# Altium schematic sheet board.SchDoc: Display & buttons board
size A3; Revision: 1; SheetNumber: 6; SheetTotal: 29
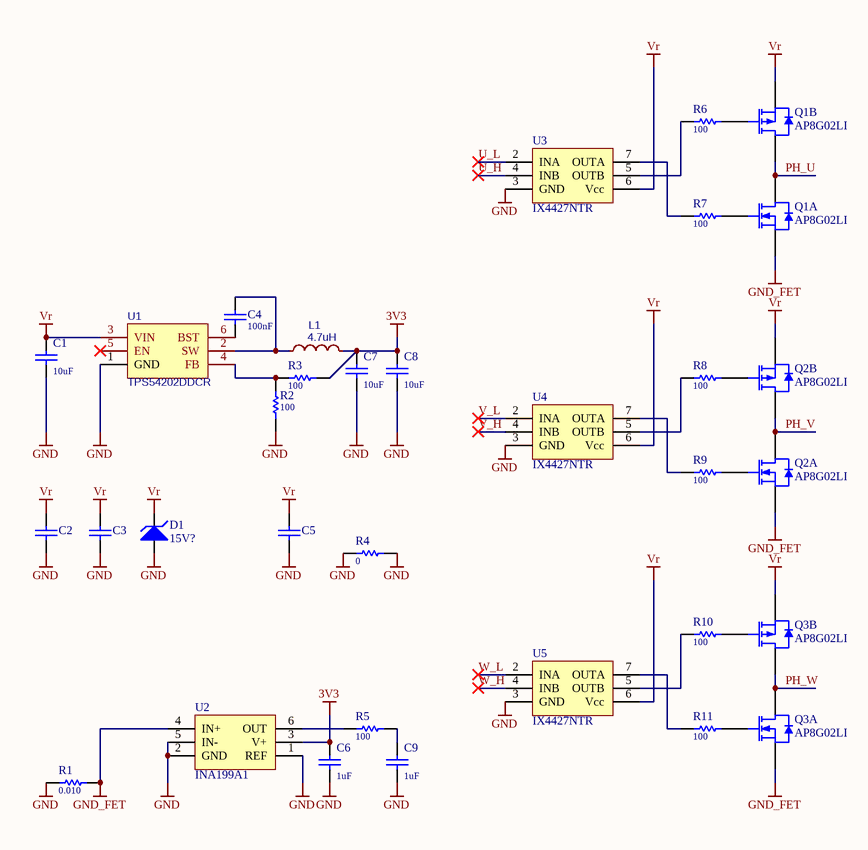
[diagram p0: board.SchDoc]

## Parts
C1  10uF  [C1206]
C2  4n7  [C1210-2.5MM]  (value not drawn)
C3  4n7  [C1210-2.5MM]  (value not drawn)
C4  100nF  [C0402]
C5  4n7  [C0603]  (value not drawn)
C6  1uF  [C0603]
C7  10uF  [C1206]
C8  10uF  [C1206]
C9  1uF  [C0603]
D1  15V?  [SMB]
L1  4.7uH  [IND-SMD_L4.4-W4.2]
Q1  AP8G02LI  [SOT-23-6]  (parts A,B of 2)
Q2  AP8G02LI  [SOT-23-6]  (parts A,B of 2)
Q3  AP8G02LI  [SOT-23-6]  (parts A,B of 2)
R1  0.010  [R1206]
R2  100  [R0603]
R3  100  [R0603]
R4  0  [R1206]
R5  100  [R0603]
R6  100  [R0603]
R7  100  [R0603]
R8  100  [R0603]
R9  100  [R0603]
R10  100  [R0603]
R11  100  [R0603]
U1  TPS54202DDCR  [SOT-23-6]
U2  INA199A1  [SC-70-6]
U3  IX4427NTR  [SO-8]
U4  IX4427NTR  [SO-8]
U5  IX4427NTR  [SO-8]

## Nets
3V3: C6.2 C7.2 C8.2 L1.2 R3.2 U2.3(V+)
GND: C1.1 C2.2 C3.2 C5.2 C6.1 C7.1 C8.1 C9.1 D1.1(A) R1.1 R2.1 R4.1 R4.2 U1.1(GND) U2.1(REF) U2.2(GND) U2.5(IN-) U3.3(GND) U4.3(GND) U5.3(GND)
GND_FET: Q1.5(S1) Q2.5(S1) Q3.5(S1) R1.2 U2.4(IN+)
Vr: C1.2 C2.1 C3.1 C5.1 D1.2(K) Q1.2(S2) Q2.2(S2) Q3.2(S2) U1.3(VIN) U3.6(Vcc) U4.6(Vcc) U5.6(Vcc)
PH_U: Q1.4(D2) Q1.6(D1)
PH_V: Q2.4(D2) Q2.6(D1)
PH_W: Q3.4(D2) Q3.6(D1)
U_H: U3.4(INB)
U_L: U3.2(INA)
V_H: U4.4(INB)
V_L: U4.2(INA)
W_H: U5.4(INB)
W_L: U5.2(INA)
NetC4_1: C4.1 U1.6(BST)
NetC4_2: C4.2 L1.1 U1.2(SW)
NetC9_2: C9.2 R5.2
NetQ1_1: Q1.1(G1) R7.2
NetQ1_3: Q1.3(G2) R6.2
NetQ2_1: Q2.1(G1) R9.2
NetQ2_3: Q2.3(G2) R8.2
NetQ3_1: Q3.1(G1) R11.2
NetQ3_3: Q3.3(G2) R10.2
NetR2_2: R2.2 R3.1 U1.4(FB)
NetR5_1: R5.1 U2.6(OUT)
NetR6_1: R6.1 U3.5(OUTB)
NetR7_1: R7.1 U3.7(OUTA)
NetR8_1: R8.1 U4.5(OUTB)
NetR9_1: R9.1 U4.7(OUTA)
NetR10_1: R10.1 U5.5(OUTB)
NetR11_1: R11.1 U5.7(OUTA)

Not connected (* = marked no-connect by the designer): U1 5(EN)*

## Library data of the parts
C1 C7 C8 = CAP: P/N: CL31B106KBHNNNE; LCSC part number: C89632
C2 C3 C5 = CAP: 4n7 0402
C4 = CAP
C6 C9 = CAP: 1uF 0603
D1 = SMCJ54A
L1 = 4.7uH: P/N: FXL0420-4R7-M; LCSC part number: C167208
Q1-Q3 = AP8G02LI: MOSFET N-CH & P-CH; P/N: IRLML2502TRPBF; LCSC part number: C2589
R1-R3 R5-R11 = RES: P/N: RC0402FR-0718KL; LCSC part number: C138044
R4 = RES
U1 = AP63203WU-7